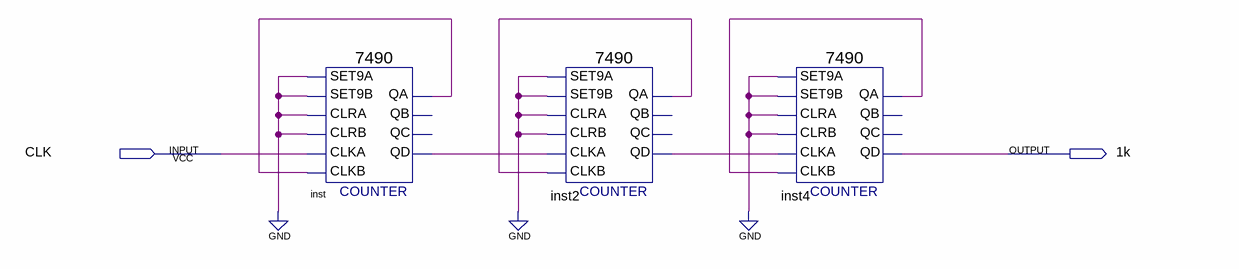
[diagram p0: schematic sheet]
// Quartus schematic FPGA_Mod1k.bdf as structural Verilog: 3 symbols, 2 pins
module FPGA_Mod1k (
  input  CLK,
  output \1k 
);

  wire inst2_qa, inst2_qd, inst4_qa, inst_qa, inst_qd;

  \7490  inst (
    .SET9A(1'b0), .CLRA(1'b0), .SET9B(1'b0), .CLKB(inst_qa), .CLKA(CLK), .CLRB(1'b0), .QD(inst_qd),
    .QA(inst_qa));  // open: QB, QC
  \7490  inst2 (
    .SET9A(1'b0), .CLRA(1'b0), .SET9B(1'b0), .CLKB(inst2_qa), .CLKA(inst_qd), .CLRB(1'b0), .QD(inst2_qd),
    .QA(inst2_qa));  // open: QB, QC
  \7490  inst4 (
    .SET9A(1'b0), .CLRA(1'b0), .SET9B(1'b0), .CLKB(inst4_qa), .CLKA(inst2_qd), .CLRB(1'b0), .QD(\1k ),
    .QA(inst4_qa));  // open: QB, QC
endmodule
